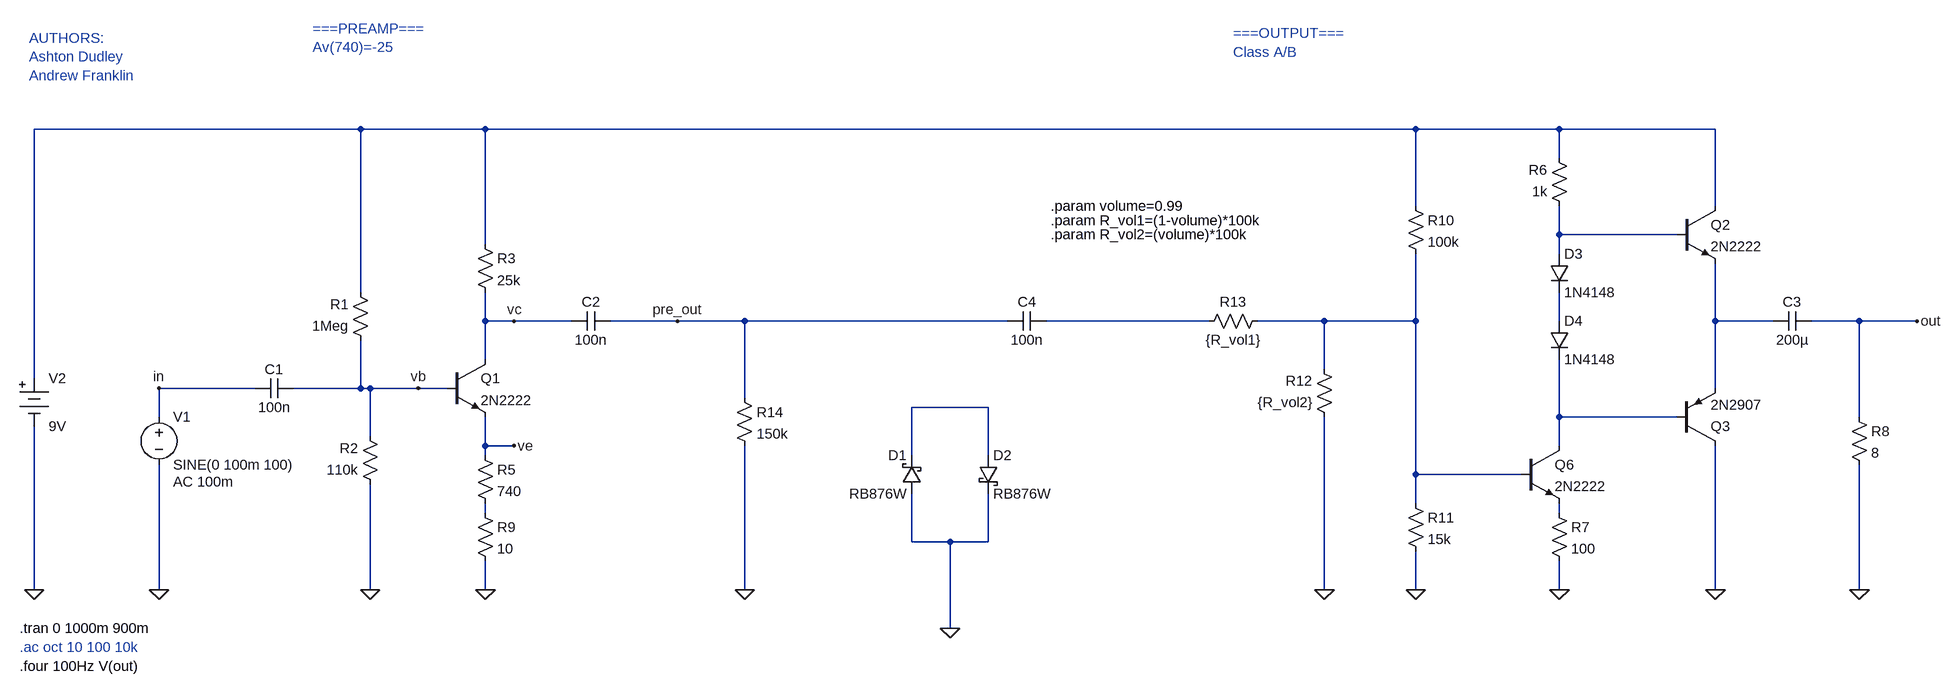
[diagram p0: schematic Guitar Pedal 261002.asc]
Guitar Pedal 261002.asc, the LTspice schematic file:
Version 4.1
SHEET 1 3000 964
WIRE 0 -304 -544 -304
WIRE 208 -304 0 -304
WIRE 2032 -304 208 -304
WIRE 2288 -304 2032 -304
WIRE 2608 -304 2288 -304
WIRE 2288 -256 2288 -304
WIRE 2032 -176 2032 -304
WIRE 2608 -176 2608 -304
WIRE 2288 -128 2288 -176
WIRE 2544 -128 2288 -128
WIRE 208 -112 208 -304
WIRE 2288 -96 2288 -128
WIRE 0 -32 0 -304
WIRE 208 16 208 -32
WIRE 256 16 208 16
WIRE 352 16 256 16
WIRE 528 16 416 16
WIRE 640 16 528 16
WIRE 1120 16 640 16
WIRE 1456 16 1184 16
WIRE 1648 16 1536 16
WIRE 2032 16 2032 -96
WIRE 2032 16 1648 16
WIRE 2288 16 2288 -32
WIRE 2608 16 2608 -80
WIRE 2704 16 2608 16
WIRE 2848 16 2768 16
WIRE 2944 16 2848 16
WIRE 208 80 208 16
WIRE 1648 96 1648 16
WIRE -544 112 -544 -304
WIRE -176 128 -336 128
WIRE 0 128 0 48
WIRE 0 128 -112 128
WIRE 16 128 0 128
WIRE 96 128 16 128
WIRE 144 128 96 128
WIRE 2608 128 2608 16
WIRE 640 144 640 16
WIRE 1088 160 960 160
WIRE -336 176 -336 128
WIRE 2288 176 2288 80
WIRE 2544 176 2288 176
WIRE 2848 176 2848 16
WIRE 16 208 16 128
WIRE 208 224 208 176
WIRE 256 224 208 224
WIRE 2288 224 2288 176
WIRE 208 240 208 224
WIRE 960 240 960 160
WIRE 1088 240 1088 160
WIRE 2032 272 2032 16
WIRE 2224 272 2032 272
WIRE 2032 320 2032 272
WIRE 208 336 208 320
WIRE 2288 336 2288 320
WIRE 960 384 960 304
WIRE 1024 384 960 384
WIRE 1088 384 1088 304
WIRE 1088 384 1024 384
WIRE -544 464 -544 192
WIRE -336 464 -336 256
WIRE 16 464 16 288
WIRE 208 464 208 416
WIRE 640 464 640 224
WIRE 1648 464 1648 176
WIRE 2032 464 2032 400
WIRE 2288 464 2288 416
WIRE 2608 464 2608 224
WIRE 2848 464 2848 256
WIRE 1024 528 1024 384
FLAG 16 464 0
FLAG 528 16 pre_out
FLAG -336 128 in
FLAG -336 464 0
FLAG 208 464 0
FLAG -544 464 0
FLAG 256 224 ve
FLAG 256 16 vc
FLAG 96 128 vb
FLAG 2288 464 0
FLAG 2608 464 0
FLAG 2848 464 0
FLAG 2944 16 out
FLAG 2032 464 0
FLAG 1648 464 0
FLAG 1024 528 0
FLAG 640 464 0
SYMBOL npn 144 80 R0
SYMATTR InstName Q1
SYMATTR Value 2N2222
SYMBOL res 16 64 R180
WINDOW 0 36 76 Left 2
WINDOW 3 36 40 Left 2
SYMATTR InstName R1
SYMATTR Value 1Meg
SYMBOL res 32 304 R180
WINDOW 0 36 76 Left 2
WINDOW 3 36 40 Left 2
SYMATTR InstName R2
SYMATTR Value 110k
SYMBOL voltage -336 160 R0
WINDOW 123 24 124 Left 2
WINDOW 39 0 0 Left 0
SYMATTR Value2 AC 100m
SYMATTR InstName V1
SYMATTR Value SINE(0 100m 100)
SYMBOL Misc\\battery -544 96 R0
WINDOW 123 0 0 Left 0
WINDOW 39 0 0 Left 0
SYMATTR InstName V2
SYMATTR Value 9V
SYMBOL cap -112 112 R90
WINDOW 0 0 32 VBottom 2
WINDOW 3 32 32 VTop 2
SYMATTR InstName C1
SYMATTR Value 100n
SYMBOL res 192 -128 R0
SYMATTR InstName R3
SYMATTR Value 25k
SYMBOL res 192 224 R0
SYMATTR InstName R5
SYMATTR Value 740
SYMBOL npn 2544 -176 R0
SYMATTR InstName Q2
SYMATTR Value 2N2222
SYMBOL pnp 2544 224 M180
SYMATTR InstName Q3
SYMATTR Value 2N2907
SYMBOL res 2304 -160 R180
WINDOW 0 36 76 Left 2
WINDOW 3 36 40 Left 2
SYMATTR InstName R6
SYMATTR Value 1k
SYMBOL res 2272 320 R0
SYMATTR InstName R7
SYMATTR Value 100
SYMBOL res 2832 160 R0
SYMATTR InstName R8
SYMATTR Value 8
SYMBOL res 192 320 R0
SYMATTR InstName R9
SYMATTR Value 10
SYMBOL npn 2224 224 R0
SYMATTR InstName Q6
SYMATTR Value 2N2222
SYMBOL res 2016 -192 R0
SYMATTR InstName R10
SYMATTR Value 100k
SYMBOL res 2016 304 R0
SYMATTR InstName R11
SYMATTR Value 15k
SYMBOL schottky 976 304 R180
WINDOW 0 24 64 Left 2
WINDOW 3 24 0 Left 2
SYMATTR InstName D1
SYMATTR Value RB876W
SYMATTR Description Zener Diode
SYMATTR Type zener
SYMBOL cap 1120 32 R270
WINDOW 0 32 32 VTop 2
WINDOW 3 0 32 VBottom 2
SYMATTR InstName C4
SYMATTR Value 100n
SYMBOL res 1664 192 R180
WINDOW 0 36 76 Left 2
WINDOW 3 36 40 Left 2
SYMATTR InstName R12
SYMATTR Value {R_vol2}
SYMBOL res 1552 0 R90
WINDOW 0 0 56 VBottom 2
WINDOW 3 32 56 VTop 2
SYMATTR InstName R13
SYMATTR Value {R_vol1}
SYMBOL cap 352 32 R270
WINDOW 0 32 32 VTop 2
WINDOW 3 0 32 VBottom 2
SYMATTR InstName C2
SYMATTR Value 100n
SYMBOL schottky 1072 240 R0
SYMATTR InstName D2
SYMATTR Value RB876W
SYMATTR Description Zener Diode
SYMATTR Type zener
SYMBOL res 624 128 R0
SYMATTR InstName R14
SYMATTR Value 150k
SYMBOL diode 2272 -96 R0
SYMATTR InstName D3
SYMATTR Value 1N4148
SYMBOL diode 2272 16 R0
SYMATTR InstName D4
SYMATTR Value 1N4148
SYMBOL cap 2768 0 R90
WINDOW 0 0 32 VBottom 2
WINDOW 3 32 32 VTop 2
SYMATTR InstName C3
SYMATTR Value 200µ
TEXT -568 528 Left 2 !.tran 0 1000m 900m
TEXT -568 560 Left 2 ;.ac oct 10 100 10k
TEXT -568 592 Left 2 !.four 100Hz V(out)
TEXT -552 -456 Left 2 ;AUTHORS:\nAshton Dudley\nAndrew Franklin
TEXT -80 -472 Left 2 ;===PREAMP===\nAv(740)=-25
TEXT 1496 -464 Left 2 ;===OUTPUT===\nClass A/B
TEXT 1192 -176 Left 2 !.param volume=0.99
TEXT 1192 -152 Left 2 !.param R_vol1=(1-volume)*100k
TEXT 1192 -128 Left 2 !.param R_vol2=(volume)*100k

The netlist it stands for:
* Guitar Pedal 261002.asc
Q1 vc vb ve 0 2N2222
R1 vb N001 1Meg
R2 0 vb 110k
V1 in 0 SINE(0 100m 100) AC 100m
V2 N001 0 9V
C1 vb in 100n
R3 N001 vc 25k
R5 ve N009 740
Q2 N001 N002 N006 0 2N2222
Q3 0 N008 N006 0 2N2907
R6 N002 N001 1k
R7 N010 0 100
R8 out 0 8
R9 N009 0 10
Q6 N008 N004 N010 0 2N2222
R10 N001 N004 100k
R11 N004 0 15k
D1 0 N007 RB876W
C4 pre_out N003 100n
R12 0 N004 {R_vol2}
R13 N004 N003 {R_vol1}
C2 vc pre_out 100n
D2 N007 0 RB876W
R14 pre_out 0 150k
D3 N002 N005 1N4148
D4 N005 N008 1N4148
C3 out N006 200µ
.model D D
.lib standard.dio
.model NPN NPN
.model PNP PNP
.lib standard.bjt
.tran 0 1000m 900m
* .ac oct 10 100 10k
.four 100Hz V(out)
* AUTHORS:
* Ashton Dudley
* Andrew Franklin
* ===PREAMP===
* Av(740)=-25
* ===OUTPUT===
* Class A/B
.param volume=0.99
.param R_vol1=(1-volume)*100k
.param R_vol2=(volume)*100k
.backanno
.end